# Altium schematic sheet ffultra_wireless.SchDoc
size A4; SheetNumber: 7; SheetTotal: 13
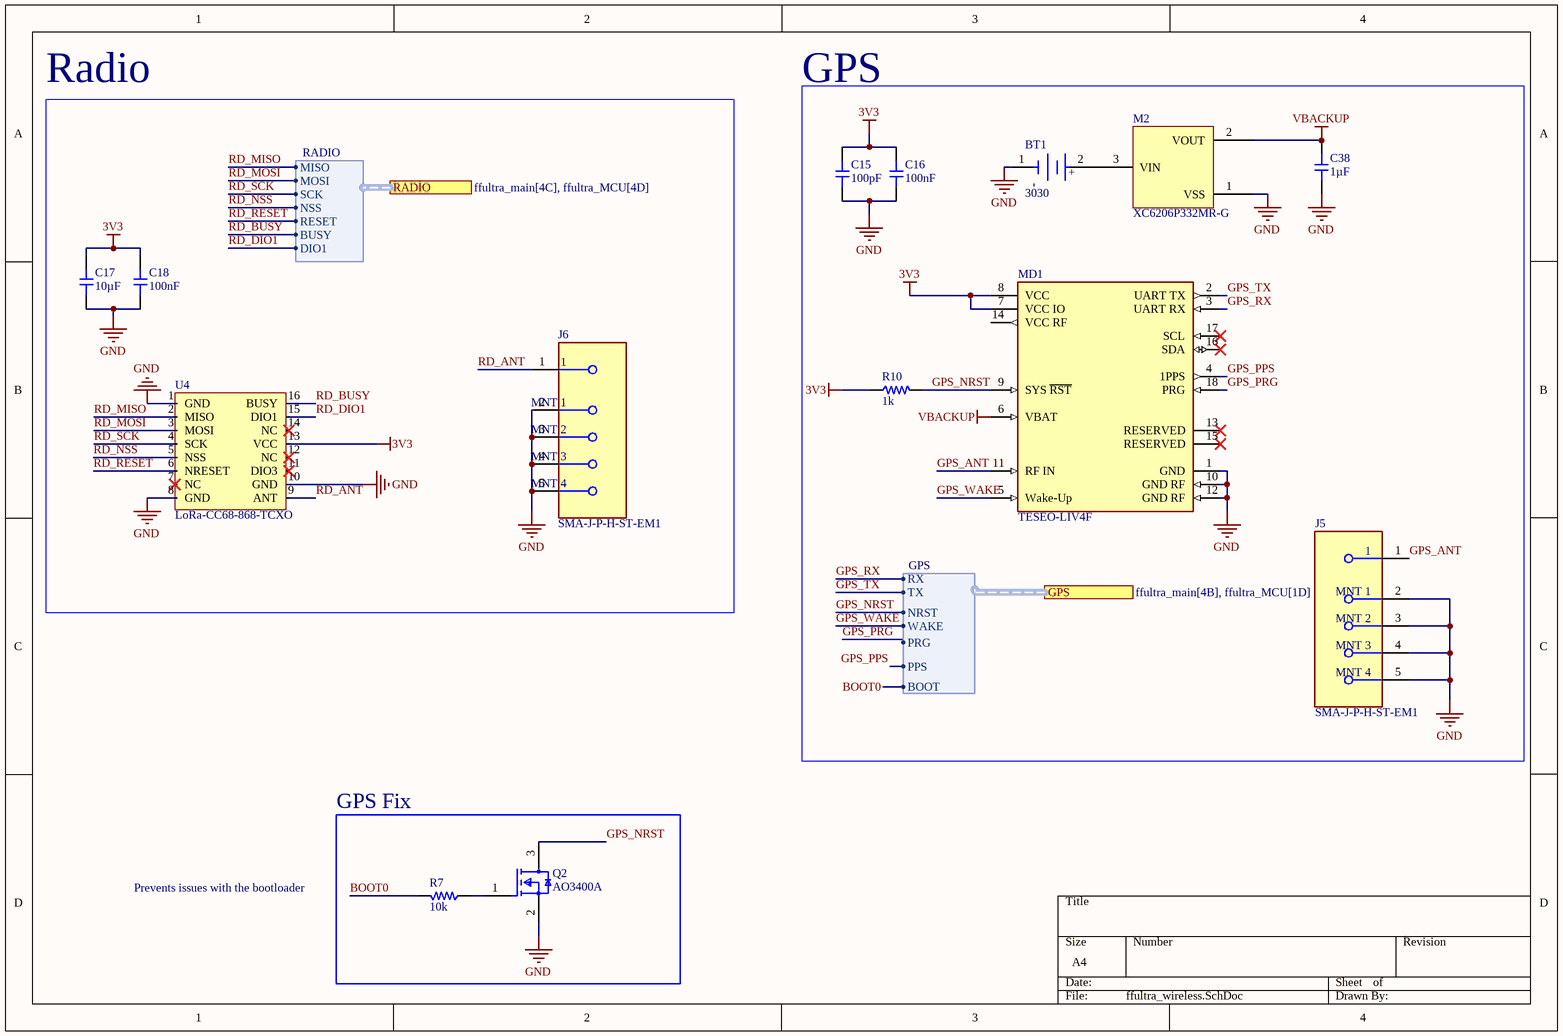
[diagram p0: ffultra_wireless.SchDoc]

## Parts
BT1  3030  [FP-3030-MFG]  (no BOM)
C15  value 100pF  [CAP-0402]  (hidden comment: 0402CG101J500NT)
C16  value 100nF  [CAP-0402]  (hidden comment: CL05B104KO5NNNC)
C17  value 10µF  [CAP-0402]  (hidden comment: GRM155R61A106ME44D)
C18  value 100nF  [CAP-0402]  (hidden comment: CL05B104KO5NNNC)
C38  value 1µF  [CAP-0402]  (hidden comment: CL05A105KA5NQNC)
J5  SMA-J-P-H-ST-EM1  [Copy of FP-SMA-J-P-H-ST-EM1-MFG]  (no BOM)
J6  SMA-J-P-H-ST-EM1  [SMA-J-P-H-ST-EM1-With-868-ant]  (no BOM)
M2  XC6206P332MR-G  [SOT95P245X110-3N]
MD1  TESEO-LIV4F  [FP-LCC-18-MFG]  (no BOM)
Q2  AO3400A  [FP-SOT23-IPC_C]
R7  value 10k  [RES-0402]  (hidden comment: 0402WGF1002TCE)
R10  value 1k  [RES-0402]  (hidden comment: 0402WGF1001TCE)
U4  LoRa-CC68-868-TCXO  [LoRa-CC68-868-TCXO-Footprint-1]  (no BOM)

## Blocks framed on the sheet
GPS: BT1 C15 C16 C38 J5 M2 MD1 R10
Radio: C17 C18 J6 U4
GPS Fix: Q2 R7

## Ports
GPS (harness GPS, see ffultra_main[4B], ffultra_MCU[1D]), RADIO (harness RADIO, see ffultra_main[4C], ffultra_MCU[4D])

## Harnesses
RADIO: MISO, MOSI, SCK, NSS, RESET, BUSY, DIO1
GPS: RX, TX, NRST, WAKE, PRG, PPS, BOOT

## Nets
3V3: C15.2 C16.2 C17.2 C18.2 MD1.7(VCC_IO) MD1.8(VCC) R10.1 U4.13(VCC)
GND: BT1.1(C) C15.1 C16.1 C17.1 C18.1 C38.2 J5.2(MNT_1) J5.3(MNT_2) J5.4(MNT_3) J5.5(MNT_4) J6.2(MNT_1) J6.3(MNT_2) J6.4(MNT_3) J6.5(MNT_4) M2.1(VSS) MD1.1(GND) MD1.10(GND_RF) MD1.12(GND_RF) Q2.2(S) U4.1(GND) U4.8(GND) U4.10(GND)
VBACKUP: C38.1 M2.2(VOUT) MD1.6(VBAT)
BOOT0: R7.2 ; port GPS.BOOT
GPS_ANT: J5.1 MD1.11(RF_IN)
GPS_NRST: MD1.9(SYS_~{RST}) Q2.3(D) R10.2 ; port GPS.NRST
GPS_PPS: MD1.4(1PPS) ; port GPS.PPS
GPS_PRG: MD1.18(PRG) ; port GPS.PRG
GPS_RX: MD1.3(UART_RX) ; port GPS.RX
GPS_TX: MD1.2(UART_TX) ; port GPS.TX
GPS_WAKE: MD1.5(Wake-Up) ; port GPS.WAKE
RD_ANT: J6.1 U4.9(ANT)
RD_BUSY: U4.16(BUSY) ; port RADIO.BUSY
RD_DIO1: U4.15(DIO1) ; port RADIO.DIO1
RD_MISO: U4.2(MISO) ; port RADIO.MISO
RD_MOSI: U4.3(MOSI) ; port RADIO.MOSI
RD_NSS: U4.5(NSS) ; port RADIO.NSS
RD_RESET: U4.6(NRESET) ; port RADIO.RESET
RD_SCK: U4.4(SCK) ; port RADIO.SCK
NetBT1_2: BT1.2(A) M2.3(VIN)
NetQ2_1: Q2.1(G) R7.1

Not connected (* = marked no-connect by the designer): MD1 13(RESERVED)* 14(VCC_RF) 15(RESERVED)* 16(SDA)* 17(SCL)*; U4 7(NC)* 11(DIO3)* 12(NC)* 14(NC)*

## Notes on the sheet
- Prevents issues with the bootloader
- (in symbol CMP-002-00103-4) +; -

## Library data of the parts
BT1 = CMP-002-00103-4: Batteries/Accessories; RoHS Compliant: Yes
C15 = CMP-001-00112-1: Capacitor, Ceramic (MLCC), 100pF, ±5%, 50V, C0G, ±5%, SMD 0402; Manufacturer: FH(Guangdong Fenghua Advanced Tech); Temperature Coefficient: C0G; ComponentLink2Description: JLCPCB Part URL; JLCPCB Basic Part: Yes; Manufacturer Part Number: 0402CG101J500NT; Design Item ID: 0402CG101J500NT; Category: Capacitors - MLCC; RoHS: Yes; JLCPCB Part Number: C1546; ComponentLink3URL: https://lcsc.com/product-detail/Multilayer-Ceramic-Capacitors-MLCC---SMD-SMT_FH-Guangdong-Fenghua-Advanced-Tech-FH-Guangdong-Fenghua-Advanced-Tech-0402CG101J500NT_C1546.html; Source: jlcpcb_capacitors_basic.schlib; Case/Package: 0402; ComponentLink1URL: https://datasheet.lcsc.com/lcsc/1810151218_FH--Guangdong-Fenghua-Advanced-Tech-0402CG101J500NT_C1546.pdf; ComponentLink2URL: https://jlcpcb.com/partdetail/C1546; Voltage Rating: 50V; ComponentLink1Description: Datasheet; Tolerance: 5%; ComponentLink3Description: LCSC Part URL
C16 C18 = CMP-001-00142-1: Capacitor, Ceramic (MLCC), 100nF, ±10%, 16V, X7R, ±10%, SMD 0402; Manufacturer: Samsung Electro-Mechanics; Design Item ID: CL05B104KO5NNNC; Source: jlcpcb_capacitors_basic.schlib; ComponentLink2URL: https://jlcpcb.com/partdetail/C1525; Voltage Rating: 16V; Tolerance: 10%; Temperature Coefficient: X7R; ComponentLink2Description: JLCPCB Part URL; ComponentLink1URL: https://datasheet.lcsc.com/lcsc/1810191219_Samsung-Electro-Mechanics-CL05B104KO5NNNC_C1525.pdf; JLCPCB Basic Part: Yes; JLCPCB Part Number: C1525; ComponentLink3URL: https://lcsc.com/product-detail/Multilayer-Ceramic-Capacitors-MLCC---SMD-SMT_Samsung-Electro-Mechanics-Samsung-Electro-Mechanics-CL05B104KO5NNNC_C1525.html; Manufacturer Part Number: CL05B104KO5NNNC; ComponentLink1Description: Datasheet; Case/Package: 0402; RoHS: Yes; Category: Capacitors - MLCC; ComponentLink3Description: LCSC Part URL
C17 = CMP-001-01770-1: Capacitor, Ceramic (MLCC), 10uF, ±20%, 10V, X5R, ±20%, SMD 0402; Manufacturer: Murata Electronics; Manufacturer Part Number: GRM155R61A106ME44D; ComponentLink3URL: https://lcsc.com/product-detail/Multilayer-Ceramic-Capacitors-MLCC---SMD-SMT_Murata-Electronics-Murata-Electronics-GRM155R61A106ME44D_C77000.html; Case/Package: 0402; Category: Capacitors - MLCC; Design Item ID: GRM155R61A106ME44D; JLCPCB Part Number: C77000; Source: jlcpcb_capacitors_extended_0402.schlib; ComponentLink2URL: https://jlcpcb.com/partdetail/C77000; Temperature Coefficient: X5R; ComponentLink3Description: LCSC Part URL; Tolerance: 20%; RoHS: Yes; JLCPCB Basic Part: No; ComponentLink2Description: JLCPCB Part URL; Voltage Rating: 10V; ComponentLink1Description: Datasheet; ComponentLink1URL: https://datasheet.lcsc.com/lcsc/1811141510_Murata-Electronics-GRM155R61A106ME44D_C77000.pdf
C38 = CMP-001-00135-1: Capacitor, Ceramic (MLCC), 1uF, ±10%, 25V, X5R, ±10%, SMD 0402; Manufacturer: Samsung Electro-Mechanics; Voltage Rating: 25V; RoHS: Yes; Temperature Coefficient: X5R; Tolerance: 10%; Source: jlcpcb_capacitors_basic.schlib; ComponentLink1URL: https://datasheet.lcsc.com/lcsc/1811091611_Samsung-Electro-Mechanics-CL05A105KA5NQNC_C52923.pdf; JLCPCB Basic Part: Yes; ComponentLink1Description: Datasheet; ComponentLink2URL: https://jlcpcb.com/partdetail/C52923; Case/Package: 0402; ComponentLink3Description: LCSC Part URL; Manufacturer Part Number: CL05A105KA5NQNC; ComponentLink3URL: https://lcsc.com/product-detail/Multilayer-Ceramic-Capacitors-MLCC---SMD-SMT_Samsung-Electro-Mechanics-Samsung-Electro-Mechanics-CL05A105KA5NQNC_C52923.html; Design Item ID: CL05A105KA5NQNC; JLCPCB Part Number: C52923; ComponentLink2Description: JLCPCB Part URL; Category: Capacitors - MLCC
J5 J6 = CMP-002-00115-5: RF SMA Connector, 1 Contact(s), Female, Board Mount, Surface Mount Terminal, Locking, Jack; Max Operating Temperature: 125°C; Mounting Technology: Board; Connector Type: SMA; RoHS Compliant: Yes; Min Operating Temperature: -65°C
M2 = CMP-00004-4: Fixed Positive LDO Regulator, 3.3V, 0.68V Dropout, CMOS, PDSO3; JLCPCB Part Number: C5446
MD1 = CMP-00025-00006-2: Telecom Circuit, 1-Func; Min Operating Temperature: -40°C; Length: 10.1mm; Height - Seated (Max): 2.3mm; Max Operating Temperature: 85°C; Pins: 18; RoHS Compliant: Yes
Q2 = CMP-013-00038-1: N沟道 VDS=30V VGS=±12V ID=5.7A P=1.4W; JLCPCB Part Number: C20917
R7 = CMP-009-00191-1: Resistor, 10kΩ, ±1%, 62.5mW, 50V, ±100ppm/℃, -55℃~+155℃, SMD 0402; Manufacturer: Uniroyal; Temperature Rating: -55℃~+155℃; ComponentLink1URL: https://datasheet.lcsc.com/lcsc/2206010100_UNI-ROYAL-Uniroyal-Elec-0402WGF1002TCE_C25744.pdf; Source: jlcpcb_resistors_basic.schlib; Tolerance: 1%; Design Item ID: 0402WGF1002TCE; ComponentLink1Description: Datasheet; ComponentLink2URL: https://jlcpcb.com/partdetail/C25744; Category: Resistors; JLCPCB Part Number: C25744; ComponentLink2Description: JLCPCB Part URL; Temperature Coefficient: ±100ppm/℃; JLCPCB Basic Part: Yes; Power Rating: 62.5mW; Case/Package: 0402; Voltage Rating: 50V; Manufacturer Part Number: 0402WGF1002TCE
R10 = CMP-009-00190-1: Resistor, 1kΩ, ±1%, 62.5mW, 50V, ±100ppm/℃, -55℃~+155℃, SMD 0402; Manufacturer: Uniroyal; Voltage Rating: 50V; Case/Package: 0402; ComponentLink1Description: Datasheet; Category: Resistors; ComponentLink1URL: https://datasheet.lcsc.com/lcsc/2206010216_UNI-ROYAL-Uniroyal-Elec-0402WGF1001TCE_C11702.pdf; Manufacturer Part Number: 0402WGF1001TCE; Tolerance: 1%; ComponentLink2Description: JLCPCB Part URL; Source: jlcpcb_resistors_basic.schlib; ComponentLink2URL: https://jlcpcb.com/partdetail/C11702; Temperature Coefficient: ±100ppm/℃; Design Item ID: 0402WGF1001TCE; Power Rating: 62.5mW; Temperature Rating: -55℃~+155℃; JLCPCB Basic Part: Yes; JLCPCB Part Number: C11702
U4 = CMP-00025-00003-3: LoRa-CC68 targeting 868MHz and with a TXCO